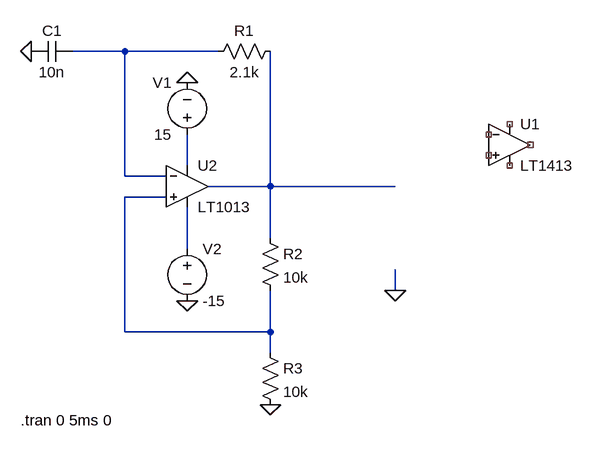
[diagram p0: schematic exp5.asc]
exp5.asc, the LTspice schematic file:
Version 4.1
SHEET 1 880 680
WIRE 112 -32 32 -32
WIRE 256 -32 112 -32
WIRE 208 144 208 96
WIRE 112 160 112 -32
WIRE 176 160 112 160
WIRE 336 176 336 -32
WIRE 336 176 240 176
WIRE 528 176 336 176
WIRE 176 192 112 192
WIRE 336 256 336 176
WIRE 208 272 208 208
WIRE 528 336 528 304
WIRE 112 400 112 192
WIRE 336 400 336 336
WIRE 336 400 112 400
WIRE 336 432 336 400
FLAG 208 352 0
FLAG 208 16 0
FLAG -32 -32 0
FLAG 336 512 0
FLAG 528 336 0
SYMBOL voltage 208 112 R180
WINDOW 0 24 96 Left 2
WINDOW 3 24 16 Left 2
WINDOW 123 0 0 Left 0
WINDOW 39 0 0 Left 0
SYMATTR InstName V1
SYMATTR Value 15
SYMBOL voltage 208 256 R0
WINDOW 123 0 0 Left 0
WINDOW 39 0 0 Left 0
SYMATTR InstName V2
SYMATTR Value -15
SYMBOL res 352 -48 R90
WINDOW 0 0 56 VBottom 2
WINDOW 3 32 56 VTop 2
SYMATTR InstName R1
SYMATTR Value 2.1k
SYMBOL cap 32 -48 R90
WINDOW 0 0 32 VBottom 2
WINDOW 3 32 32 VTop 2
SYMATTR InstName C1
SYMATTR Value 10n
SYMBOL res 320 240 R0
SYMATTR InstName R2
SYMATTR Value 10k
SYMBOL res 320 416 R0
SYMATTR InstName R3
SYMATTR Value 10k
SYMBOL OpAmps\\LT1413 704 48 R0
SYMATTR InstName U1
SYMBOL OpAmps\\LT1013 208 112 R0
SYMATTR InstName U2
TEXT -48 536 Left 2 !.tran 0 5ms 0

The netlist it stands for:
* exp5.asc
V1 N002 0 15
V2 N005 0 -15
R1 N003 N001 2.1k
C1 N001 0 10n
R2 N003 N004 10k
R3 N004 0 10k
X§U1 NC_01 NC_02 NC_03 NC_04 NC_05 LT1413  ; pins In+ In- V+ V- OUT
X§U2 N004 N001 N002 N005 N003 LT1013  ; pins In+ In- V+ V- OUT
.tran 0 5ms 0
.lib LTC.lib
.backanno
.end